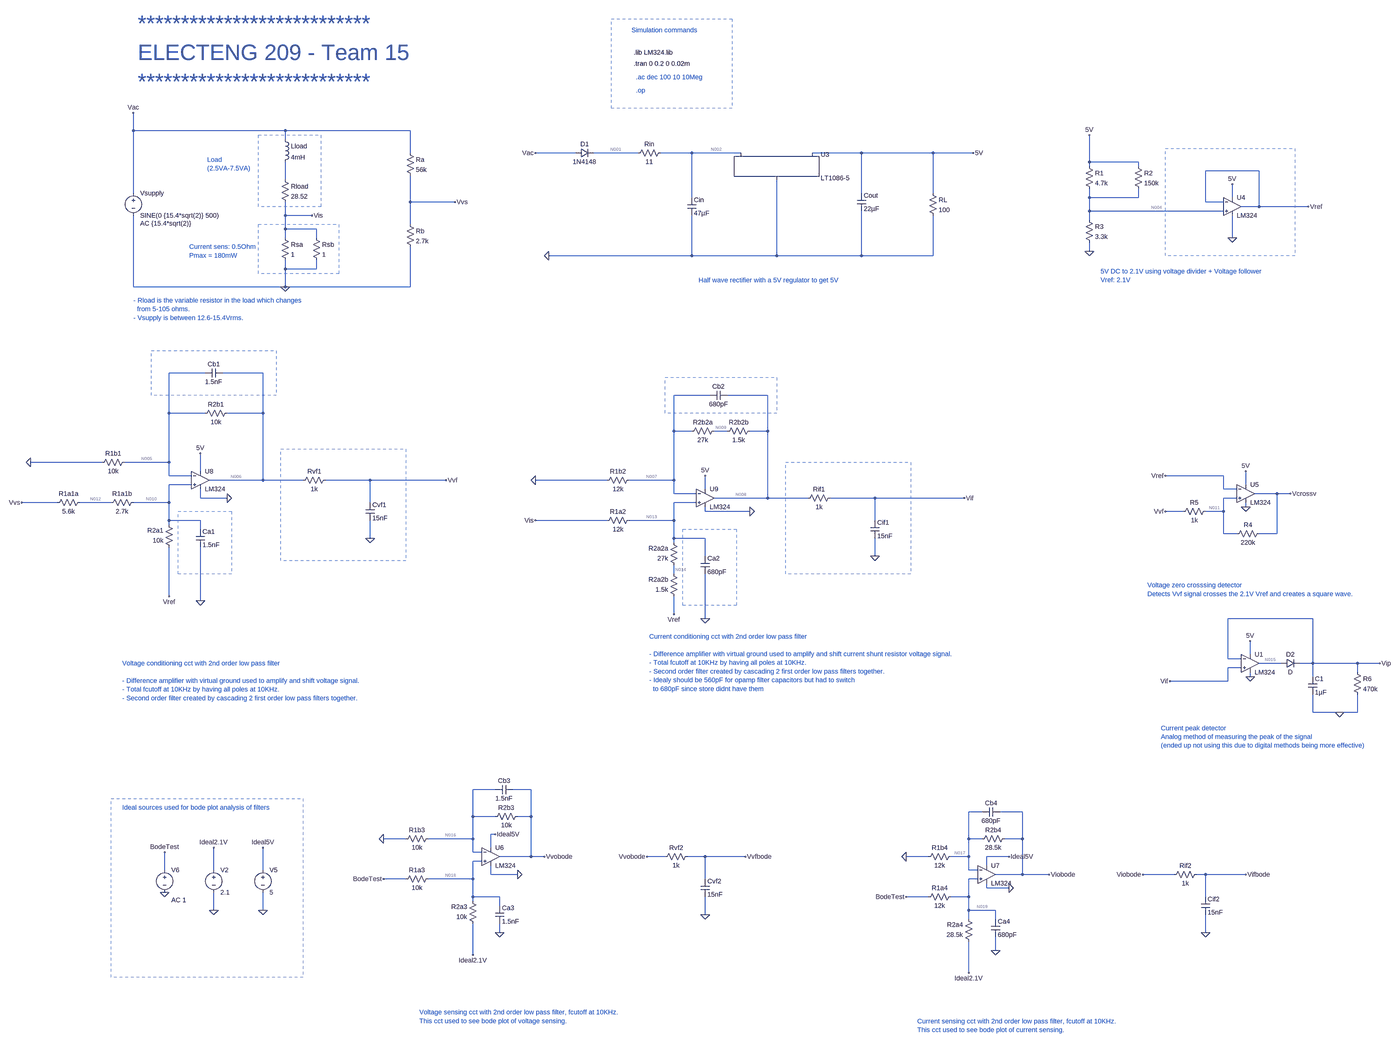
[diagram p0: schematic Front end sim.asc, whole sheet]
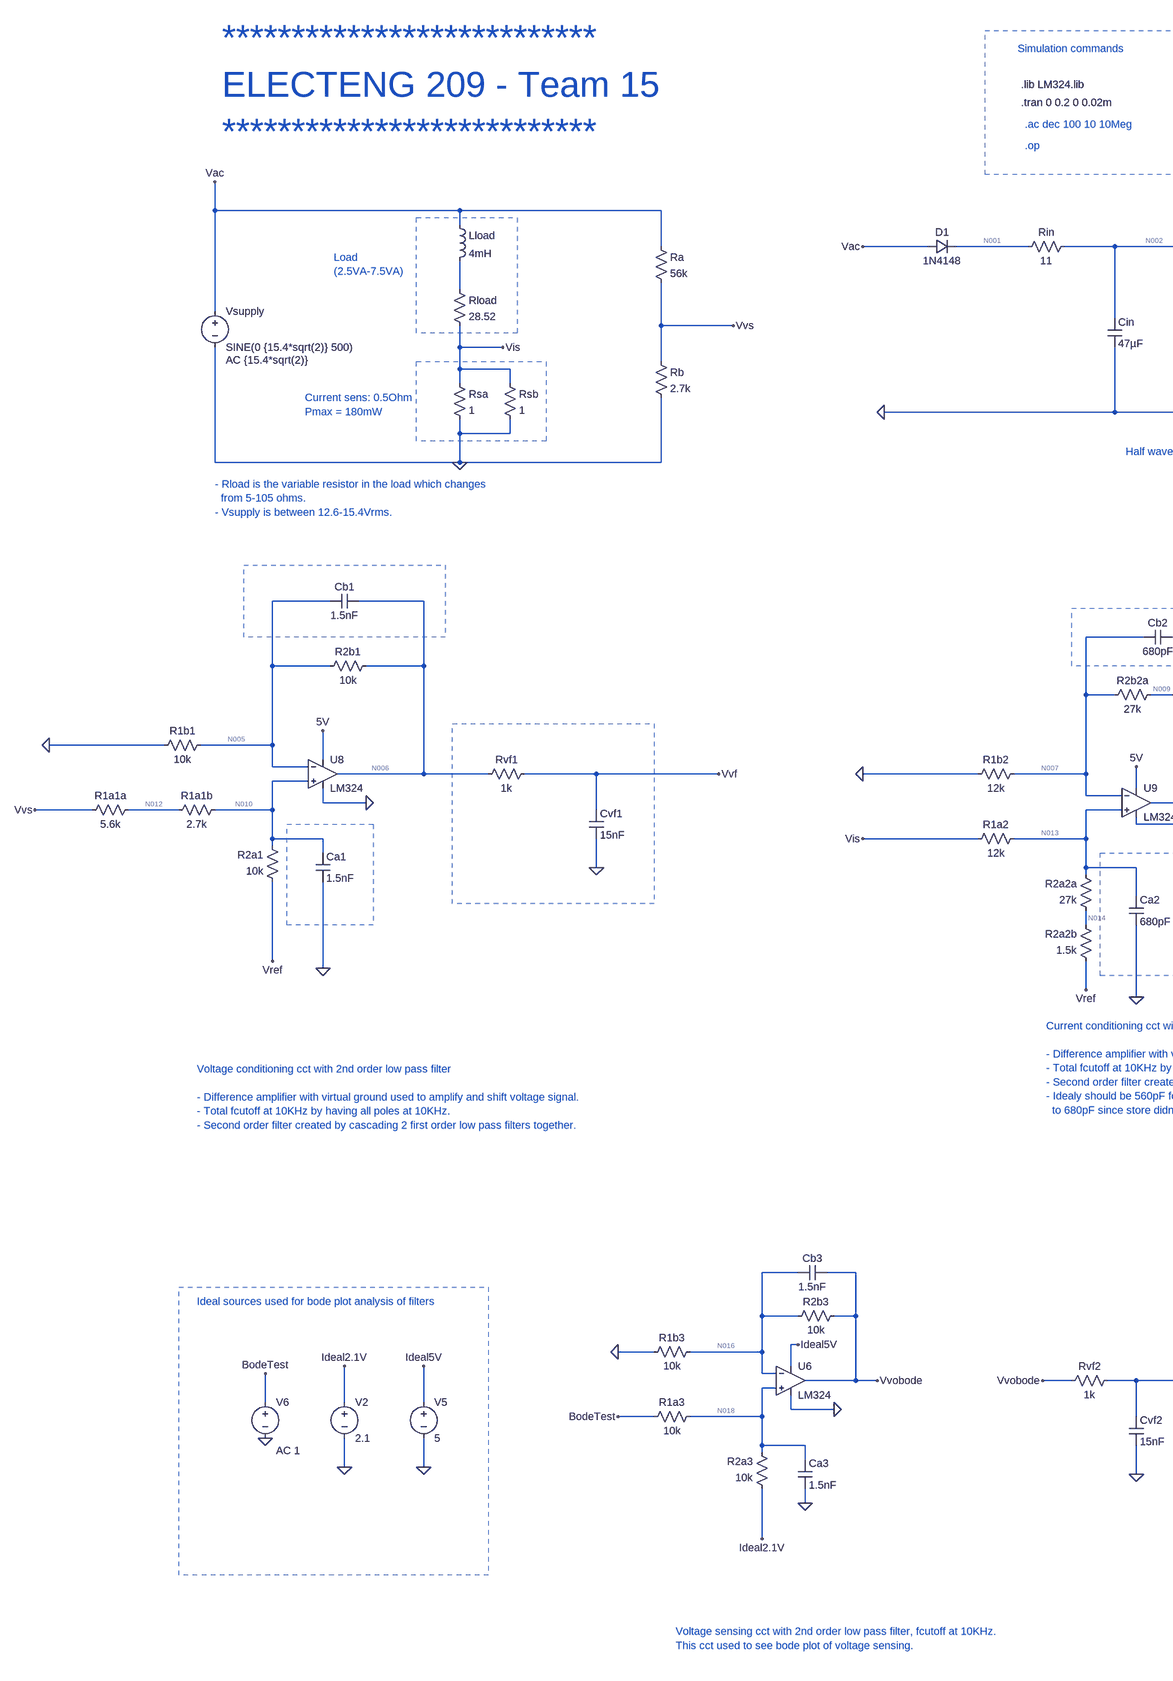
[diagram p1: schematic Front end sim.asc, part, row 1 of 1, column 1 of 2]
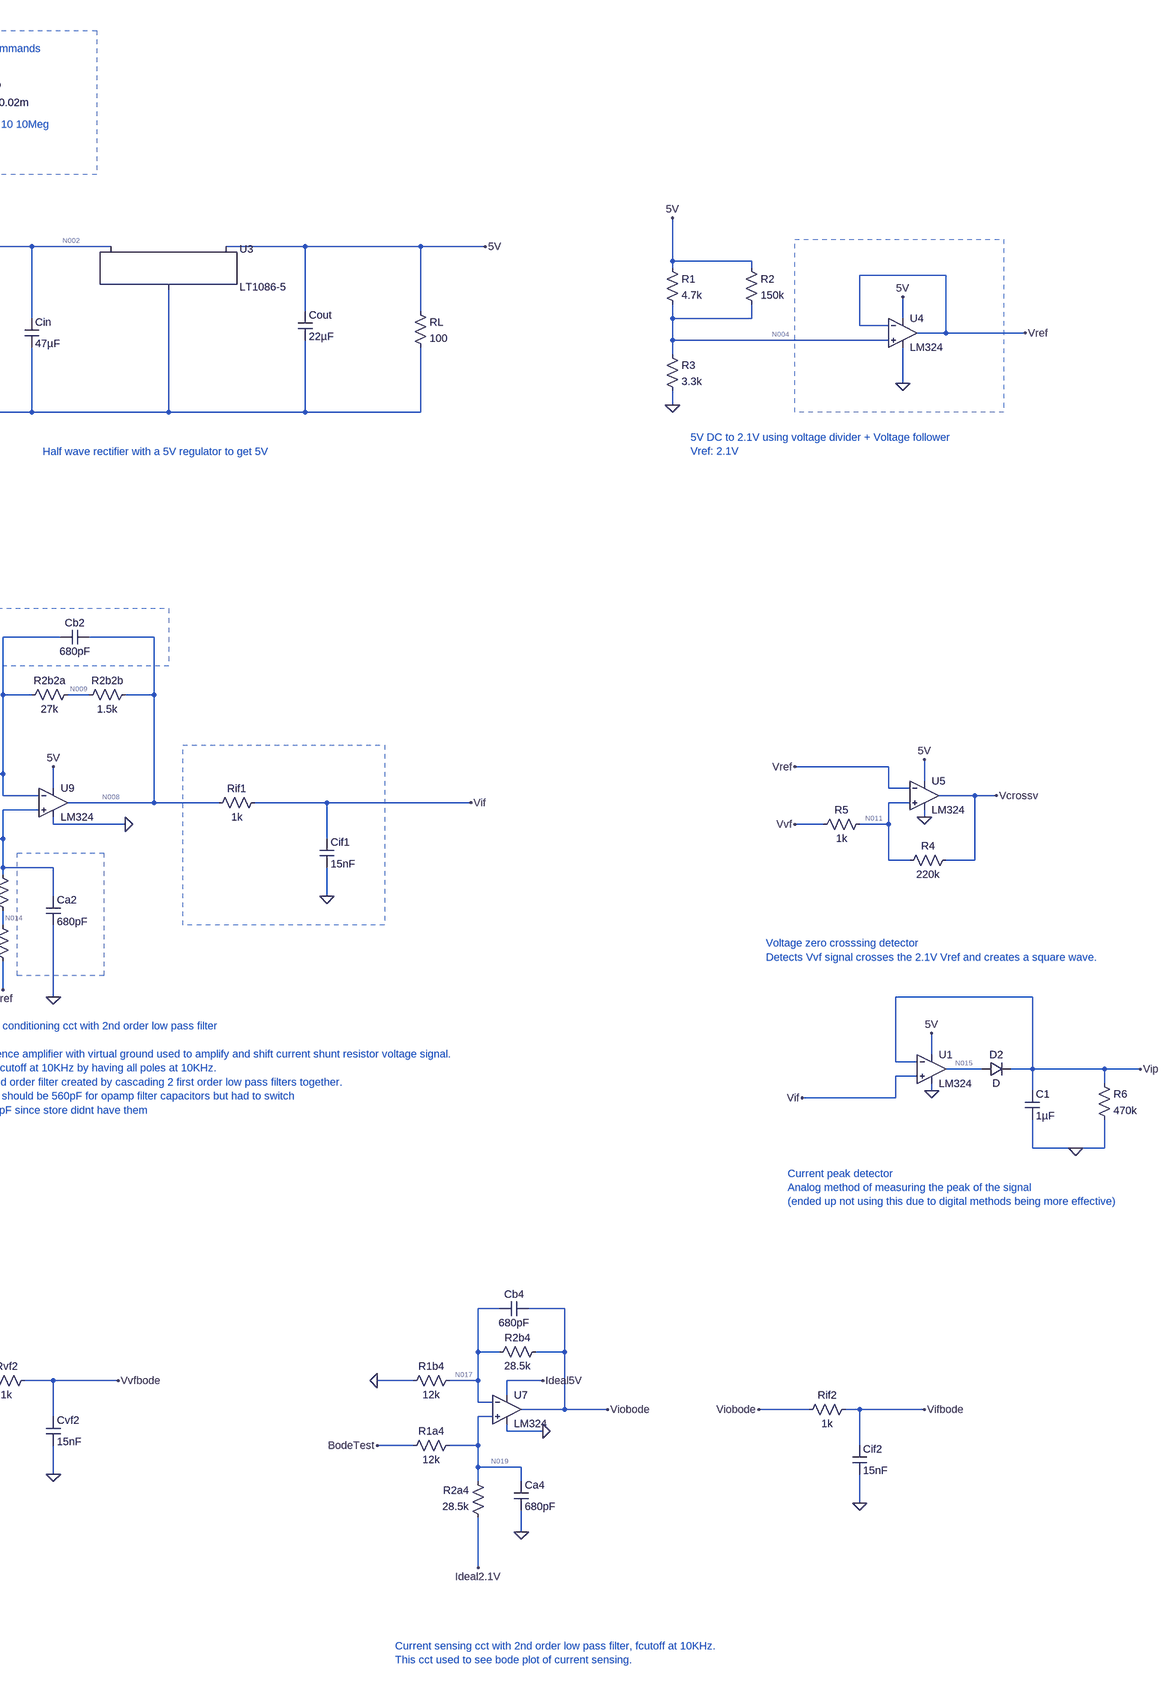
[diagram p2: schematic Front end sim.asc, part, row 1 of 1, column 2 of 2]
Front end sim.asc, the LTspice schematic file:
Version 4.1
SHEET 1 4416 2988
WIRE -2832 -368 -2832 -432
WIRE -2288 -368 -2832 -368
WIRE -1840 -368 -2288 -368
WIRE -2288 -336 -2288 -368
WIRE -1840 -288 -1840 -368
WIRE -1248 -288 -1392 -288
WIRE -1024 -288 -1184 -288
WIRE -832 -288 -944 -288
WIRE -656 -288 -832 -288
WIRE -224 -288 -400 -288
WIRE 32 -288 -224 -288
WIRE 176 -288 32 -288
WIRE 592 -256 592 -352
WIRE 768 -256 592 -256
WIRE 592 -240 592 -256
WIRE 768 -240 768 -256
WIRE 1200 -224 1008 -224
WIRE -2288 -192 -2288 -256
WIRE -2832 -144 -2832 -368
WIRE -224 -144 -224 -288
WIRE 32 -144 32 -288
WIRE -832 -128 -832 -288
WIRE 592 -128 592 -160
WIRE 768 -128 768 -160
WIRE 768 -128 592 -128
WIRE 1104 -128 1104 -176
WIRE -1840 -112 -1840 -208
WIRE -1680 -112 -1840 -112
WIRE 1008 -112 1008 -224
WIRE 1072 -112 1008 -112
WIRE 1200 -96 1200 -224
WIRE 1200 -96 1136 -96
WIRE 1376 -96 1200 -96
WIRE 592 -80 592 -128
WIRE 1072 -80 592 -80
WIRE -2288 -64 -2288 -112
WIRE -2192 -64 -2288 -64
WIRE 592 -48 592 -80
WIRE -1840 -32 -1840 -112
WIRE -2288 -16 -2288 -64
WIRE -2176 -16 -2288 -16
WIRE -2288 16 -2288 -16
WIRE -2176 16 -2176 -16
WIRE 1104 16 1104 -64
WIRE 592 64 592 32
WIRE -832 80 -832 -64
WIRE -832 80 -1344 80
WIRE -528 80 -528 -192
WIRE -528 80 -832 80
WIRE -224 80 -224 -80
WIRE -224 80 -528 80
WIRE 32 80 32 -64
WIRE 32 80 -224 80
WIRE -2288 128 -2288 96
WIRE -2176 128 -2176 96
WIRE -2176 128 -2288 128
WIRE -2832 192 -2832 -64
WIRE -2288 192 -2288 128
WIRE -2288 192 -2832 192
WIRE -1840 192 -1840 48
WIRE -1840 192 -2288 192
WIRE -2576 512 -2704 512
WIRE -2368 512 -2512 512
WIRE -768 592 -896 592
WIRE -560 592 -704 592
WIRE -2704 656 -2704 512
WIRE -2576 656 -2704 656
WIRE -2368 656 -2368 512
WIRE -2368 656 -2496 656
WIRE -896 720 -896 592
WIRE -832 720 -896 720
WIRE -704 720 -752 720
WIRE -560 720 -560 592
WIRE -560 720 -624 720
WIRE -2944 832 -3200 832
WIRE -2704 832 -2704 656
WIRE -2704 832 -2864 832
WIRE -2592 864 -2592 800
WIRE -2704 880 -2704 832
WIRE -2624 880 -2704 880
WIRE 1072 880 864 880
WIRE -2368 896 -2368 656
WIRE -2368 896 -2560 896
WIRE -2224 896 -2368 896
WIRE -1984 896 -2144 896
WIRE -1712 896 -1984 896
WIRE -1136 896 -1392 896
WIRE -896 896 -896 720
WIRE -896 896 -1056 896
WIRE -2624 912 -2704 912
WIRE 1152 912 1152 864
WIRE -784 928 -784 880
WIRE 1072 928 1072 880
WIRE 1120 928 1072 928
WIRE -896 944 -896 896
WIRE -816 944 -896 944
WIRE 1264 944 1184 944
WIRE 1312 944 1264 944
WIRE -2592 960 -2592 928
WIRE -2496 960 -2592 960
WIRE -560 960 -560 720
WIRE -560 960 -752 960
WIRE -416 960 -560 960
WIRE -176 960 -336 960
WIRE 144 960 -176 960
WIRE 1120 960 1072 960
WIRE -3104 976 -3232 976
WIRE -2912 976 -3024 976
WIRE -2704 976 -2704 912
WIRE -2704 976 -2832 976
WIRE -1984 976 -1984 896
WIRE -816 976 -896 976
WIRE 1152 992 1152 976
WIRE -784 1008 -784 992
WIRE -624 1008 -784 1008
WIRE 928 1008 864 1008
WIRE 1072 1008 1072 960
WIRE 1072 1008 1008 1008
WIRE -2704 1040 -2704 976
WIRE -2592 1040 -2704 1040
WIRE -1136 1040 -1392 1040
WIRE -896 1040 -896 976
WIRE -896 1040 -1056 1040
WIRE -176 1040 -176 960
WIRE -2704 1056 -2704 1040
WIRE -2592 1072 -2592 1040
WIRE 1072 1088 1072 1008
WIRE 1120 1088 1072 1088
WIRE 1264 1088 1264 944
WIRE 1264 1088 1200 1088
WIRE -1984 1104 -1984 1040
WIRE -896 1104 -896 1040
WIRE -784 1104 -896 1104
WIRE -896 1120 -896 1104
WIRE -784 1168 -784 1104
WIRE -176 1168 -176 1104
WIRE -896 1232 -896 1200
WIRE -2704 1312 -2704 1136
WIRE -2592 1328 -2592 1136
WIRE -896 1376 -896 1312
WIRE -784 1392 -784 1232
WIRE 1392 1392 1088 1392
WIRE 1168 1520 1168 1472
WIRE 1088 1536 1088 1392
WIRE 1136 1536 1088 1536
WIRE 1280 1552 1200 1552
WIRE 1392 1552 1392 1392
WIRE 1392 1552 1344 1552
WIRE 1552 1552 1392 1552
WIRE 1632 1552 1552 1552
WIRE 1136 1568 1088 1568
WIRE 1552 1584 1552 1552
WIRE 1168 1600 1168 1584
WIRE 1392 1600 1392 1552
WIRE 1088 1616 1088 1568
WIRE 1088 1616 880 1616
WIRE 1392 1728 1392 1664
WIRE 1488 1728 1392 1728
WIRE 1552 1728 1552 1664
WIRE 1552 1728 1488 1728
WIRE -1536 2048 -1616 2048
WIRE -1408 2048 -1472 2048
WIRE 208 2128 160 2128
WIRE 352 2128 272 2128
WIRE -1616 2144 -1616 2048
WIRE -1536 2144 -1616 2144
WIRE -1408 2144 -1408 2048
WIRE -1408 2144 -1456 2144
WIRE -1536 2208 -1552 2208
WIRE -1856 2224 -1936 2224
WIRE -1616 2224 -1616 2144
WIRE -1616 2224 -1776 2224
WIRE 160 2224 160 2128
WIRE 208 2224 160 2224
WIRE 352 2224 352 2128
WIRE 352 2224 288 2224
WIRE -1552 2256 -1552 2208
WIRE -1616 2272 -1616 2224
WIRE -1584 2272 -1616 2272
WIRE -1408 2288 -1408 2144
WIRE -1408 2288 -1520 2288
WIRE -1360 2288 -1408 2288
WIRE -928 2288 -992 2288
WIRE -784 2288 -848 2288
WIRE -640 2288 -784 2288
WIRE 16 2288 -64 2288
WIRE 160 2288 160 2224
WIRE 160 2288 96 2288
WIRE 304 2288 224 2288
WIRE -1584 2304 -1616 2304
WIRE 224 2320 224 2288
WIRE -2720 2336 -2720 2272
WIRE -2544 2336 -2544 2256
WIRE -2368 2336 -2368 2256
WIRE 160 2336 160 2288
WIRE 192 2336 160 2336
WIRE -1552 2352 -1552 2320
WIRE -1456 2352 -1552 2352
WIRE 352 2352 352 2224
WIRE 352 2352 256 2352
WIRE 448 2352 352 2352
WIRE 896 2352 784 2352
WIRE 1008 2352 976 2352
WIRE 1152 2352 1008 2352
WIRE -1856 2368 -1936 2368
WIRE -1616 2368 -1616 2304
WIRE -1616 2368 -1776 2368
WIRE -784 2368 -784 2288
WIRE 192 2368 160 2368
WIRE 224 2400 224 2384
WIRE 304 2400 224 2400
WIRE -1616 2432 -1616 2368
WIRE -1520 2432 -1616 2432
WIRE 16 2432 -64 2432
WIRE 160 2432 160 2368
WIRE 160 2432 96 2432
WIRE 1008 2432 1008 2352
WIRE -1616 2448 -1616 2432
WIRE -1520 2464 -1520 2432
WIRE -2544 2480 -2544 2416
WIRE -2368 2480 -2368 2416
WIRE 160 2480 160 2432
WIRE 256 2480 160 2480
WIRE -784 2496 -784 2432
WIRE 160 2512 160 2480
WIRE 256 2512 256 2480
WIRE -1520 2560 -1520 2528
WIRE 1008 2560 1008 2496
WIRE 256 2624 256 2576
WIRE -1616 2640 -1616 2528
WIRE 160 2704 160 2592
FLAG -2192 -64 Vis
FLAG -1680 -112 Vvs
FLAG -2544 2480 0
FLAG -2544 2256 Ideal2.1V
FLAG -2832 -432 Vac
FLAG -1392 -288 Vac
FLAG -1344 80 0
FLAG 592 -352 5V
FLAG 1104 -176 5V
FLAG 1104 16 0
FLAG 1376 -96 Vref
FLAG -2288 192 0
FLAG 1152 864 5V
FLAG 1152 992 0
FLAG 864 880 Vref
FLAG 864 1008 Vvf
FLAG 1312 944 Vcrossv
FLAG -1936 2224 0
FLAG -1616 2640 Ideal2.1V
FLAG -784 2496 0
FLAG -1456 2352 0
FLAG -64 2288 0
FLAG -64 2432 BodeTest
FLAG 160 2704 Ideal2.1V
FLAG 1008 2560 0
FLAG 1152 2352 Vifbode
FLAG 304 2400 0
FLAG 304 2288 Ideal5V
FLAG -640 2288 Vvfbode
FLAG -2368 2480 0
FLAG -2368 2256 Ideal5V
FLAG -1536 2208 Ideal5V
FLAG -2720 2416 0
FLAG -2720 2272 BodeTest
FLAG -1936 2368 BodeTest
FLAG -3200 832 0
FLAG -2704 1312 Vref
FLAG -1984 1104 0
FLAG -2496 960 0
FLAG -1392 896 0
FLAG -1392 1040 Vis
FLAG -896 1376 Vref
FLAG -176 1168 0
FLAG 144 960 Vif
FLAG -624 1008 0
FLAG -784 880 5V
FLAG -1712 896 Vvf
FLAG -2592 800 5V
FLAG -3232 976 Vvs
FLAG 176 -288 5V
FLAG -992 2288 Vvobode
FLAG -1360 2288 Vvobode
FLAG 448 2352 Viobode
FLAG 784 2352 Viobode
FLAG 592 64 0
FLAG -2592 1328 0
FLAG 256 2624 0
FLAG -784 1392 0
FLAG -1520 2560 0
FLAG 1168 1472 5V
FLAG 1168 1600 0
FLAG 880 1616 Vif
FLAG 1488 1728 0
FLAG 1632 1552 Vip
SYMBOL ind -2304 -352 R0
SYMATTR InstName Lload
SYMATTR Value 4mH
SYMATTR SpiceLine Rser=1m
SYMBOL res -2304 -208 R0
SYMATTR InstName Rload
SYMATTR Value 28.52
SYMBOL res -2192 0 R0
SYMATTR InstName Rsb
SYMATTR Value 1
SYMBOL res -1856 -304 R0
SYMATTR InstName Ra
SYMATTR Value 56k
SYMBOL res -1856 -48 R0
SYMATTR InstName Rb
SYMATTR Value 2.7k
SYMBOL res -2304 0 R0
SYMATTR InstName Rsa
SYMATTR Value 1
SYMBOL voltage -2544 2320 R0
WINDOW 123 0 0 Left 0
WINDOW 39 0 0 Left 0
SYMATTR InstName V2
SYMATTR Value 2.1
SYMBOL diode -1248 -272 R270
WINDOW 0 32 32 VTop 2
WINDOW 3 0 32 VBottom 2
SYMATTR InstName D1
SYMATTR Value 1N4148
SYMBOL res -928 -304 R90
WINDOW 0 0 56 VBottom 2
WINDOW 3 32 56 VTop 2
SYMATTR InstName Rin
SYMATTR Value 11
SYMBOL cap -848 -128 R0
SYMATTR InstName Cin
SYMATTR Value 47µF
SYMBOL cap -240 -144 R0
SYMATTR InstName Cout
SYMATTR Value 22µF
SYMBOL res 576 -256 R0
SYMATTR InstName R1
SYMATTR Value 4.7k
SYMBOL res 752 -256 R0
SYMATTR InstName R2
SYMATTR Value 150k
SYMBOL res 576 -64 R0
SYMATTR InstName R3
SYMATTR Value 3.3k
SYMBOL OpAmps\\opamp2 1104 -160 R0
SYMATTR InstName U4
SYMATTR Value LM324
SYMBOL voltage -2832 -160 R0
WINDOW 123 24 124 Left 2
WINDOW 39 0 0 Left 0
SYMATTR Value2 AC {15.4*sqrt(2)}
SYMATTR InstName Vsupply
SYMATTR Value SINE(0 {15.4*sqrt(2)} 500)
SYMBOL OpAmps\\opamp2 1152 880 R0
SYMATTR InstName U5
SYMATTR Value LM324
SYMBOL OpAmps\\opamp2 -1552 2224 R0
SYMATTR InstName U6
SYMATTR Value LM324
SYMBOL res -1440 2128 R90
WINDOW 0 0 56 VBottom 2
WINDOW 3 32 56 VTop 2
SYMATTR InstName R2b3
SYMATTR Value 10k
SYMBOL res -1760 2208 R90
WINDOW 0 0 56 VBottom 2
WINDOW 3 32 56 VTop 2
SYMATTR InstName R1b3
SYMATTR Value 10k
SYMBOL res -1760 2352 R90
WINDOW 0 0 56 VBottom 2
WINDOW 3 32 56 VTop 2
SYMATTR InstName R1a3
SYMATTR Value 10k
SYMBOL res -1600 2544 R180
WINDOW 0 36 76 Left 2
WINDOW 3 36 40 Left 2
SYMATTR InstName R2a3
SYMATTR Value 10k
SYMBOL res -832 2272 R90
WINDOW 0 0 56 VBottom 2
WINDOW 3 32 56 VTop 2
SYMATTR InstName Rvf2
SYMATTR Value 1k
SYMBOL cap -800 2368 R0
SYMATTR InstName Cvf2
SYMATTR Value 15nF
SYMBOL cap -1472 2032 R90
WINDOW 0 0 32 VBottom 2
WINDOW 3 32 32 VTop 2
SYMATTR InstName Cb3
SYMATTR Value 1.5nF
SYMBOL OpAmps\\opamp2 224 2288 R0
SYMATTR InstName U7
SYMATTR Value LM324
SYMBOL res 112 2272 R90
WINDOW 0 0 56 VBottom 2
WINDOW 3 32 56 VTop 2
SYMATTR InstName R1b4
SYMATTR Value 12k
SYMBOL res 112 2416 R90
WINDOW 0 0 56 VBottom 2
WINDOW 3 32 56 VTop 2
SYMATTR InstName R1a4
SYMATTR Value 12k
SYMBOL res 992 2336 R90
WINDOW 0 0 56 VBottom 2
WINDOW 3 32 56 VTop 2
SYMATTR InstName Rif2
SYMATTR Value 1k
SYMBOL cap 992 2432 R0
SYMATTR InstName Cif2
SYMATTR Value 15nF
SYMBOL voltage -2368 2320 R0
WINDOW 123 0 0 Left 0
WINDOW 39 0 0 Left 0
SYMATTR InstName V5
SYMATTR Value 5
SYMBOL voltage -2720 2320 R0
WINDOW 123 24 124 Left 2
WINDOW 39 0 0 Left 0
SYMATTR Value2 AC 1
SYMATTR InstName V6
SYMATTR Value ""
SYMBOL OpAmps\\opamp2 -2592 832 R0
SYMATTR InstName U8
SYMATTR Value LM324
SYMBOL res -2480 640 R90
WINDOW 0 0 56 VBottom 2
WINDOW 3 32 56 VTop 2
SYMATTR InstName R2b1
SYMATTR Value 10k
SYMBOL res -2848 816 R90
WINDOW 0 0 56 VBottom 2
WINDOW 3 32 56 VTop 2
SYMATTR InstName R1b1
SYMATTR Value 10k
SYMBOL res -2816 960 R90
WINDOW 0 0 56 VBottom 2
WINDOW 3 32 56 VTop 2
SYMATTR InstName R1a1b
SYMATTR Value 2.7k
SYMBOL res -2688 1152 R180
WINDOW 0 36 76 Left 2
WINDOW 3 36 40 Left 2
SYMATTR InstName R2a1
SYMATTR Value 10k
SYMBOL res -2128 880 R90
WINDOW 0 0 56 VBottom 2
WINDOW 3 32 56 VTop 2
SYMATTR InstName Rvf1
SYMATTR Value 1k
SYMBOL cap -2000 976 R0
SYMATTR InstName Cvf1
SYMATTR Value 15nF
SYMBOL cap -2512 496 R90
WINDOW 0 0 32 VBottom 2
WINDOW 3 32 32 VTop 2
SYMATTR InstName Cb1
SYMATTR Value 1.5nF
SYMBOL OpAmps\\opamp2 -784 896 R0
SYMATTR InstName U9
SYMATTR Value LM324
SYMBOL res -736 704 R90
WINDOW 0 0 56 VBottom 2
WINDOW 3 32 56 VTop 2
SYMATTR InstName R2b2a
SYMATTR Value 27k
SYMBOL res -1040 880 R90
WINDOW 0 0 56 VBottom 2
WINDOW 3 32 56 VTop 2
SYMATTR InstName R1b2
SYMATTR Value 12k
SYMBOL res -1040 1024 R90
WINDOW 0 0 56 VBottom 2
WINDOW 3 32 56 VTop 2
SYMATTR InstName R1a2
SYMATTR Value 12k
SYMBOL res -880 1216 R180
WINDOW 0 36 76 Left 2
WINDOW 3 36 40 Left 2
SYMATTR InstName R2a2a
SYMATTR Value 27k
SYMBOL res -320 944 R90
WINDOW 0 0 56 VBottom 2
WINDOW 3 32 56 VTop 2
SYMATTR InstName Rif1
SYMATTR Value 1k
SYMBOL cap -192 1040 R0
SYMATTR InstName Cif1
SYMATTR Value 15nF
SYMBOL cap -704 576 R90
WINDOW 0 0 32 VBottom 2
WINDOW 3 32 32 VTop 2
SYMATTR InstName Cb2
SYMATTR Value 680pF
SYMBOL res 16 -160 R0
SYMATTR InstName RL
SYMATTR Value 100
SYMBOL res -608 704 R90
WINDOW 0 0 56 VBottom 2
WINDOW 3 32 56 VTop 2
SYMATTR InstName R2b2b
SYMATTR Value 1.5k
SYMBOL res -880 1328 R180
WINDOW 0 36 76 Left 2
WINDOW 3 36 40 Left 2
SYMATTR InstName R2a2b
SYMATTR Value 1.5k
SYMBOL res 176 2608 R180
WINDOW 0 36 76 Left 2
WINDOW 3 36 40 Left 2
SYMATTR InstName R2a4
SYMATTR Value 28.5k
SYMBOL cap 272 2112 R90
WINDOW 0 0 32 VBottom 2
WINDOW 3 32 32 VTop 2
SYMATTR InstName Cb4
SYMATTR Value 680pF
SYMBOL res 304 2208 R90
WINDOW 0 0 56 VBottom 2
WINDOW 3 32 56 VTop 2
SYMATTR InstName R2b4
SYMATTR Value 28.5k
SYMBOL res -3008 960 R90
WINDOW 0 0 56 VBottom 2
WINDOW 3 32 56 VTop 2
SYMATTR InstName R1a1a
SYMATTR Value 5.6k
SYMBOL cap -1536 2464 R0
SYMATTR InstName Ca3
SYMATTR Value 1.5nF
SYMBOL cap -800 1168 R0
SYMATTR InstName Ca2
SYMATTR Value 680pF
SYMBOL cap -2608 1072 R0
SYMATTR InstName Ca1
SYMATTR Value 1.5nF
SYMBOL cap 240 2512 R0
SYMATTR InstName Ca4
SYMATTR Value 680pF
SYMBOL PowerProducts\\LT1086-5 -528 -288 R0
SYMATTR InstName U3
SYMBOL res 1216 1072 R90
WINDOW 0 0 56 VBottom 2
WINDOW 3 32 56 VTop 2
SYMATTR InstName R4
SYMATTR Value 220k
SYMBOL res 1024 992 R90
WINDOW 0 0 56 VBottom 2
WINDOW 3 32 56 VTop 2
SYMATTR InstName R5
SYMATTR Value 1k
SYMBOL OpAmps\\opamp2 1168 1488 R0
SYMATTR InstName U1
SYMATTR Value LM324
SYMBOL diode 1280 1568 R270
WINDOW 0 32 32 VTop 2
WINDOW 3 0 32 VBottom 2
SYMATTR InstName D2
SYMBOL cap 1376 1600 R0
SYMATTR InstName C1
SYMATTR Value 1µF
SYMBOL res 1536 1568 R0
SYMATTR InstName R6
SYMATTR Value 470k
TEXT -1040 -648 Left 2 !.lib LM324.lib
TEXT -1040 -608 Left 2 !.tran 0 0.2 0 0.02m
TEXT -1032 -560 Left 2 ;.ac dec 100 10 10Meg
TEXT -1808 2912 Left 2 ;Voltage sensing cct with 2nd order low pass filter, fcutoff at 10KHz.\nThis cct used to see bode plot of voltage sensing.
TEXT -1032 -512 Left 2 ;.op
TEXT -24 2944 Left 2 ;Current sensing cct with 2nd order low pass filter, fcutoff at 10KHz.\nThis cct used to see bode plot of current sensing.
TEXT 800 1272 Left 2 ;Voltage zero crosssing detector\nDetects Vvf signal crosses the 2.1V Vref and creates a square wave.
TEXT -2872 2112 Left 2 ;Ideal sources used for bode plot analysis of filters
TEXT -2872 1552 Left 2 ;Voltage conditioning cct with 2nd order low pass filter\n \n- Difference amplifier with virtual ground used to amplify and shift voltage signal. \n- Total fcutoff at 10KHz by having all poles at 10KHz. \n- Second order filter created by cascading 2 first order low pass filters together.
TEXT -984 1456 Left 2 ;Current conditioning cct with 2nd order low pass filter\n \n- Difference amplifier with virtual ground used to amplify and shift current shunt resistor voltage signal. \n- Total fcutoff at 10KHz by having all poles at 10KHz. \n- Second order filter created by cascading 2 first order low pass filters together.\n- Idealy should be 560pF for opamp filter capacitors but had to switch \n  to 680pF since store didnt have them
TEXT -2632 48 Left 2 ;Current sens: 0.5Ohm\nPmax = 180mW
TEXT -2568 -264 Left 2 ;Load \n(2.5VA-7.5VA)
TEXT 632 136 Left 2 ;5V DC to 2.1V using voltage divider + Voltage follower\nVref: 2.1V
TEXT -808 168 Left 2 ;Half wave rectifier with a 5V regulator to get 5V
TEXT -2816 -752 Left 6 ;***************************\nELECTENG 209 - Team 15\n***************************
TEXT -1048 -728 Left 2 ;Simulation commands
TEXT -2832 240 Left 2 ;- Rload is the variable resistor in the load which changes\n  from 5-105 ohms.\n- Vsupply is between 12.6-15.4Vrms.
TEXT 848 1784 Left 2 ;Current peak detector\nAnalog method of measuring the peak of the signal \n(ended up not using this due to digital methods being more effective)
RECTANGLE Normal -2160 -96 -2384 -352 2
RECTANGLE Normal -2096 144 -2384 -32 2
RECTANGLE Normal 1328 80 864 -304 2
RECTANGLE Normal -1856 1184 -2304 784 2
RECTANGLE Normal -48 1232 -496 832 2
RECTANGLE Normal -2320 592 -2768 432 2
RECTANGLE Normal -528 656 -928 528 2
RECTANGLE Normal -688 -448 -1120 -768 2
RECTANGLE Normal -2224 2720 -2912 2080 2
RECTANGLE Normal -672 1344 -864 1072 2
RECTANGLE Normal -2480 1232 -2672 1008 2

The netlist it stands for:
* Front end sim.asc
Lload Vac N003 4mH Rser=1m
Rload N003 Vis 28.52
Rsb Vis 0 1
Ra Vac Vvs 56k
Rb Vvs 0 2.7k
Rsa Vis 0 1
V2 Ideal2.1V 0 2.1
D1 Vac N001 1N4148
Rin N002 N001 11
Cin N002 0 47µF
Cout 5V 0 22µF
R1 5V N004 4.7k
R2 5V N004 150k
R3 N004 0 3.3k
X§U4 N004 Vref 5V 0 Vref LM324  ; pins In+ In- V+ V- OUT
Vsupply Vac 0 SINE(0 {15.4*sqrt(2)} 500) AC {15.4*sqrt(2)}
X§U5 N011 Vref 5V 0 Vcrossv LM324  ; pins In+ In- V+ V- OUT
X§U6 N018 N016 Ideal5V 0 Vvobode LM324  ; pins In+ In- V+ V- OUT
R2b3 Vvobode N016 10k
R1b3 N016 0 10k
R1a3 N018 BodeTest 10k
R2a3 Ideal2.1V N018 10k
Rvf2 Vvfbode Vvobode 1k
Cvf2 Vvfbode 0 15nF
Cb3 Vvobode N016 1.5nF
X§U7 N019 N017 Ideal5V 0 Viobode LM324  ; pins In+ In- V+ V- OUT
R1b4 N017 0 12k
R1a4 N019 BodeTest 12k
Rif2 Vifbode Viobode 1k
Cif2 Vifbode 0 15nF
V5 Ideal5V 0 5
V6 BodeTest 0 AC 1
X§U8 N010 N005 5V 0 N006 LM324  ; pins In+ In- V+ V- OUT
R2b1 N006 N005 10k
R1b1 N005 0 10k
R1a1b N010 N012 2.7k
R2a1 Vref N010 10k
Rvf1 Vvf N006 1k
Cvf1 Vvf 0 15nF
Cb1 N006 N005 1.5nF
X§U9 N013 N007 5V 0 N008 LM324  ; pins In+ In- V+ V- OUT
R2b2a N009 N007 27k
R1b2 N007 0 12k
R1a2 N013 Vis 12k
R2a2a N014 N013 27k
Rif1 Vif N008 1k
Cif1 Vif 0 15nF
Cb2 N008 N007 680pF
RL 5V 0 100
R2b2b N008 N009 1.5k
R2a2b Vref N014 1.5k
R2a4 Ideal2.1V N019 28.5k
Cb4 Viobode N017 680pF
R2b4 Viobode N017 28.5k
R1a1a N012 Vvs 5.6k
Ca3 N018 0 1.5nF
Ca2 N013 0 680pF
Ca1 N010 0 1.5nF
Ca4 N019 0 680pF
X§U3 0 5V N002 LT1086-5
R4 Vcrossv N011 220k
R5 N011 Vvf 1k
X§U1 Vif Vip 5V 0 N015 LM324  ; pins In+ In- V+ V- OUT
D2 N015 Vip D
C1 Vip 0 1µF
R6 Vip 0 470k
.model D D
.lib standard.dio
.lib LM324.lib
.tran 0 0.2 0 0.02m
* .ac dec 100 10 10Meg
* Voltage sensing cct with 2nd order low pass filter, fcutoff at 10KHz.
* This cct used to see bode plot of voltage sensing.
* .op
* Current sensing cct with 2nd order low pass filter, fcutoff at 10KHz.
* This cct used to see bode plot of current sensing.
* Voltage zero crosssing detector
* Detects Vvf signal crosses the 2.1V Vref and creates a square wave.
* Ideal sources used for bode plot analysis of filters
* Voltage conditioning cct with 2nd order low pass filter
* - Difference amplifier with virtual ground used to amplify and shift voltage signal.
* - Total fcutoff at 10KHz by having all poles at 10KHz.
* - Second order filter created by cascading 2 first order low pass filters together.
* Current conditioning cct with 2nd order low pass filter
* - Difference amplifier with virtual ground used to amplify and shift current shunt resistor voltage signal.
* - Total fcutoff at 10KHz by having all poles at 10KHz.
* - Second order filter created by cascading 2 first order low pass filters together.
* - Idealy should be 560pF for opamp filter capacitors but had to switch
*   to 680pF since store didnt have them
* Current sens: 0.5Ohm
* Pmax = 180mW
* Load
* (2.5VA-7.5VA)
* 5V DC to 2.1V using voltage divider + Voltage follower
* Vref: 2.1V
* Half wave rectifier with a 5V regulator to get 5V
* ***************************
* ELECTENG 209 - Team 15
* ***************************
* Simulation commands
* - Rload is the variable resistor in the load which changes
*   from 5-105 ohms.
* - Vsupply is between 12.6-15.4Vrms.
* Current peak detector
* Analog method of measuring the peak of the signal
* (ended up not using this due to digital methods being more effective)
.backanno
.end

* Results of the author's LTspice run, read from the files saved beside the schematic
* Operating Point, zero values left out:
*   V(5v) = 1.207 V
*   V(ideal2.1v) = 2.1 V
*   V(ideal5v) = 5 V
*   V(n001) = 1.201 V
*   V(n002) = 1.201 V
*   V(n004) = 506.9 mV
*   V(n005) = -73.18 mV
*   V(n006) = -146.6 mV
*   V(n007) = -43.25 mV
*   V(n008) = -146.6 mV
*   V(n009) = -141.1 mV
*   V(n010) = -76.22 mV
*   V(n011) = -146.5 mV
*   V(n012) = -57.3 mV
*   V(n013) = -43.24 mV
*   V(n014) = -141.1 mV
*   V(n015) = -146.6 mV
*   V(n016) = 1.05 V
*   V(n017) = 622.5 mV
*   V(n018) = 1.05 V
*   V(n019) = 622.4 mV
*   V(vcrossv) = -146.6 mV
*   V(vif) = -146.5 mV
*   V(vifbode) = 2.1 V
*   V(viobode) = 2.1 V
*   V(vip) = 184.5 µV
*   V(vis) = -1.771 µV
*   V(vref) = -146.5 mV
*   V(vvf) = -146.5 mV
*   V(vvfbode) = 2.1 V
*   V(vvobode) = 2.1 V
*   V(vvs) = -18.05 mV
*   I(D1) = -2.521 nA
*   I(Lload) = 62.09 nA
*   I(R1) = 148.9 µA
*   I(R1a1a) = -7.009 µA
*   I(R1a1b) = -7.009 µA
*   I(R1a2) = -3.604 µA
*   I(R1a3) = 105 µA
*   I(R1a4) = 51.87 µA
*   I(R1b1) = -7.318 µA
*   I(R1b2) = -3.605 µA
*   I(R1b3) = 105 µA
*   I(R1b4) = 51.87 µA
*   I(R2) = 4.667 µA
*   I(R2a1) = -7.029 µA
*   I(R2a2a) = -3.624 µA
*   I(R2a2b) = -3.624 µA
*   I(R2a3) = 105 µA
*   I(R2a4) = 51.85 µA
*   I(R2b1) = -7.337 µA
*   I(R2b2a) = -3.625 µA
*   I(R2b2b) = -3.625 µA
*   I(R2b3) = 105 µA
*   I(R2b4) = 51.85 µA
*   I(R3) = 153.6 µA
*   I(R4) = -173.9 pA
*   I(R5) = 19.84 nA
*   I(R6) = 392.4 pA
*   I(RL) = 12.07 mA
*   I(Ra) = 322.4 nA
*   I(Rb) = -6.686 µA
*   I(Rif1) = 39.64 nA
*   I(Rin) = 2.521 nA
*   I(Rload) = 62.09 nA
*   I(Rsa) = -1.771 µA
*   I(Rsb) = -1.771 µA
*   I(Rvf1) = 19.84 nA
*   I(V2) = -156.8 µA
*   I(V5) = -350 µA
*   I(V6) = 156.9 µA
*   I(Vsupply) = -381.9 nA
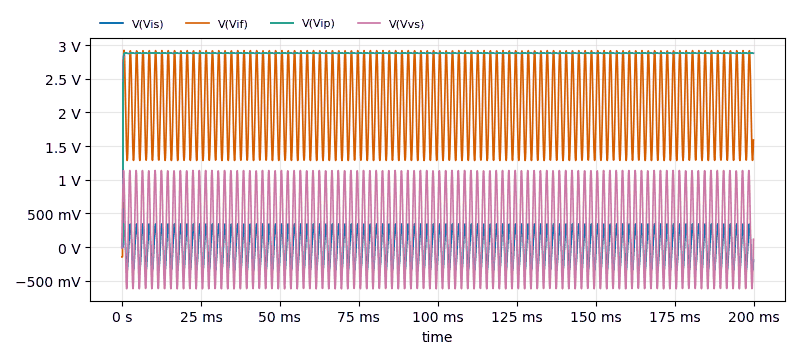
[diagram p3: Transient Analysis of Front end sim.asc, plotted from the saved traces]
* Transient Analysis, 1 run:
*   V(Vis): min -344.3 mV, max 345.8 mV, average 128 µV, rms 243.5 mV, last -136.8 mV
*   V(Vif): min -146.5 mV, max 2.921 V, average 2.098 V, rms 2.177 V, last 1.698 V
*   V(Vip): min 184.5 µV, max 2.885 V, average 2.874 V, rms 2.876 V, last 2.877 V
*   V(Vvs): min -618.8 mV, max 1.138 V, average 258.9 mV, rms 672.6 mV, last 256.5 mV